# Altium schematic sheet 6_connectors.SchDoc
size A4; SheetNumber: 6; SheetTotal: 6
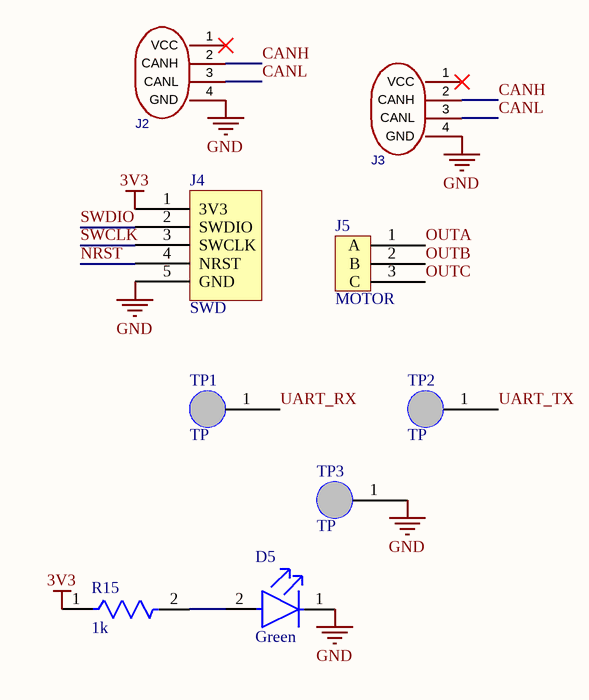
[diagram p0: 6_connectors.SchDoc]

## Parts
D5  Green  [LED_0603]
J2  SM04B-GHS-TB  [JST_GH_SM04B]  (value not drawn)
J3  SM04B-GHS-TB  [JST_GH_SM04B]  (value not drawn)
J4  SWD  [HDR_1x5_2.54]
J5  MOTOR  [MOTOR_PADS_3]
R15  1k  [RES_0603]
TP1  TP  [TP_1.5]
TP2  TP  [TP_1.5]
TP3  TP  [TP_1.5]

## Nets
3V3: J4.1(3V3) R15.1
GND: D5.1(C) J2.4(GND) J3.4(GND) J4.5(GND) TP3.1
CANH: J2.2(CANH) J3.2(CANH)
CANL: J2.3(CANL) J3.3(CANL)
NRST: J4.4(NRST)
OUTA: J5.1(A)
OUTB: J5.2(B)
OUTC: J5.3(C)
SWCLK: J4.3(SWCLK)
SWDIO: J4.2(SWDIO)
UART_RX: TP1.1
UART_TX: TP2.1
NetD5_2: D5.2(A) R15.2

Not connected (* = marked no-connect by the designer): J2 1(VCC)*; J3 1(VCC)*

## Library data of the parts
D5 = LED_0603: LED, 0603; NexarPartId: 549907; Forward Voltage: 2V; Viewing Angle: 130°; Lens Transparency: Clear; Power Rating: 75mW; Number of LEDs: 1; Luminous Intensity: 35mcd; Forward Current: 20mA; Dominant Wavelength: 571nm; Lens Color: Clear, Colorless; Reverse Voltage: 5V; Wavelength: 574nm; Number of Pins: 2; Packaging: Tape and Reel; Number of Elements: 1; Schedule B: 8541402000, 8541402000|8541402000|8541402000|8541402000|8541402000; Height: 550µm; Case/Package: 0603; Illumination Color: Green; Depth: 800µm; Max Operating Temperature: 85°C; RoHS: Compliant; Lens Style: Clear; Lead Free: Lead Free; Length: 1.6mm; Mount: Surface Mount; Test Current: 20mA; Width: 800µm; Case Code (Imperial): 0603; Min Operating Temperature: -55°C; Case Code (Metric): 1608; Radiation Hardening: No; Power Dissipation: 75mW; Color: Green; Value: Green
J2 J3 = SM04B-GHS-TB: JST GH 4-pin side entry, CAN; Symbol: SM04B-GHS-TB(LF)(SN); AddInBom: yes; ModelId: b0352f6928cf4bf099b202a6090d3c8d; ModelName: CONN-SMD_GH1.25-WS-4P; ModelTransform: 324.8025,191.3382,0,0,0,0,0,-6.024,0; Pins Structure: 1x4P; Pitch: 1.25mm; Number of PINs Per Row: 4; Current Rating: 1A; Voltage Rating: 50V; Plastic Material: PA9T; Flame Retardant Rating: UL94V-0; Supplementary Features: Auxiliary Solder Pin; Z-Height of the Board: 4.25mm; X-Length of Bottom Edge on Board (Spacing Line): 8.25mm; Y-Width of Bottom Edge on Board: 4.13mm; LCSC Part Name: 1x4P 间距:1.25mm 卧贴 系列:GH; SupplierPart: C189895; Manufacturer: JST; ManufacturerPart: SM04B-GHS-TB(LF)(SN); Supplier Footprint: SMD,P=1.25mm,卧贴; JLCPCB Part Class: Extended Part; Datasheet: https://item.szlcsc.com/datasheet/SM04B-GHS-TB(LF)(SN)/207060.html; Supplier: LCSC; ConvertToPcb: yes; FootprintName: CONN-SMD_4P-P1.25_SM04B-GHS-TB-LF-SN; Mounting Type: Surface Mount, Right Angle; Reference Series: GH; Number of Pins: 4P; Number of Rows: 1; Row Spacing: -; Contact Material: Phosphor bronze; Contact Plating: Tin; Operating Temperature: -25℃~+85℃; Color: White
J4 = SWD: SWD header 1x5 2.54 mm
J5 = MOTOR_PADS_3: Motor phase solder pads
R15 = RES_0603: Resistor, 0603; Value: 1k
TP1-TP3 = TP_1.5: Test pad, 1.5 mm round